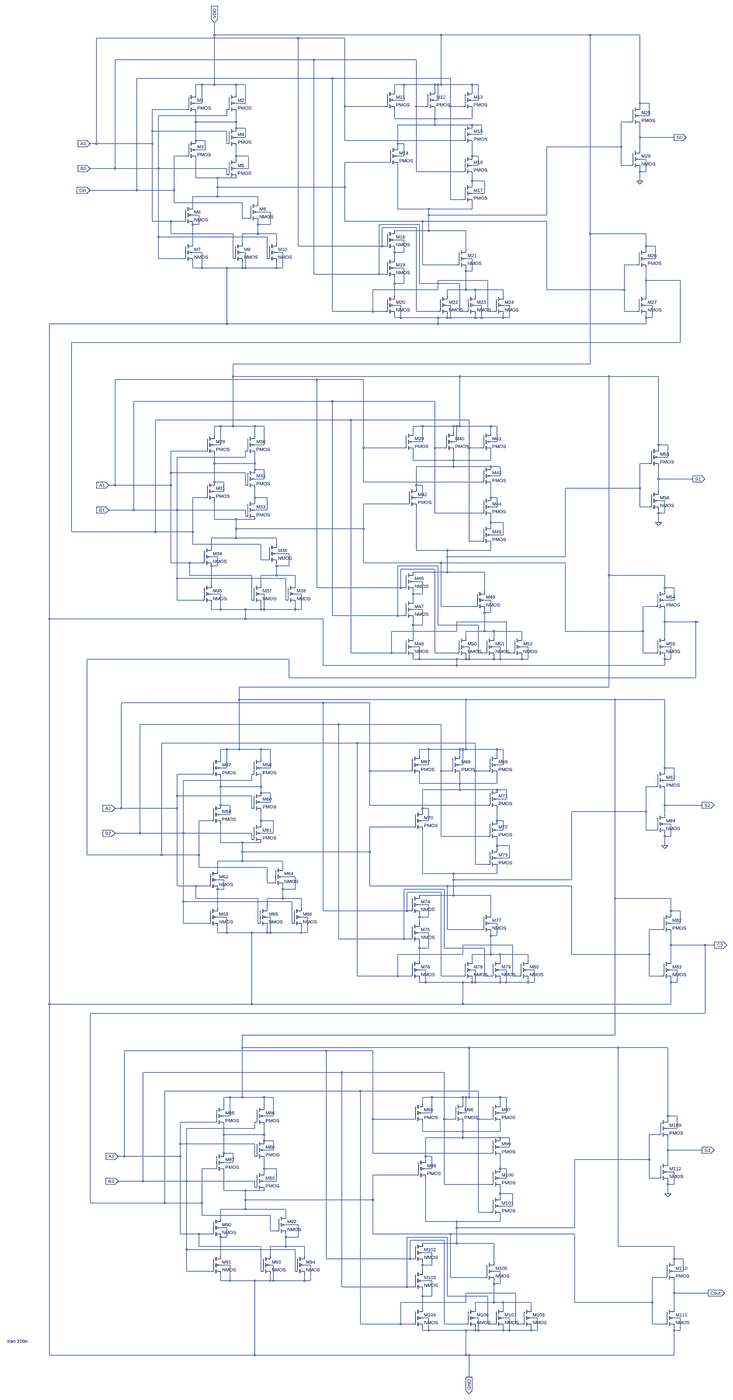
[diagram p0: schematic 4bit_Adder.asc, whole sheet]
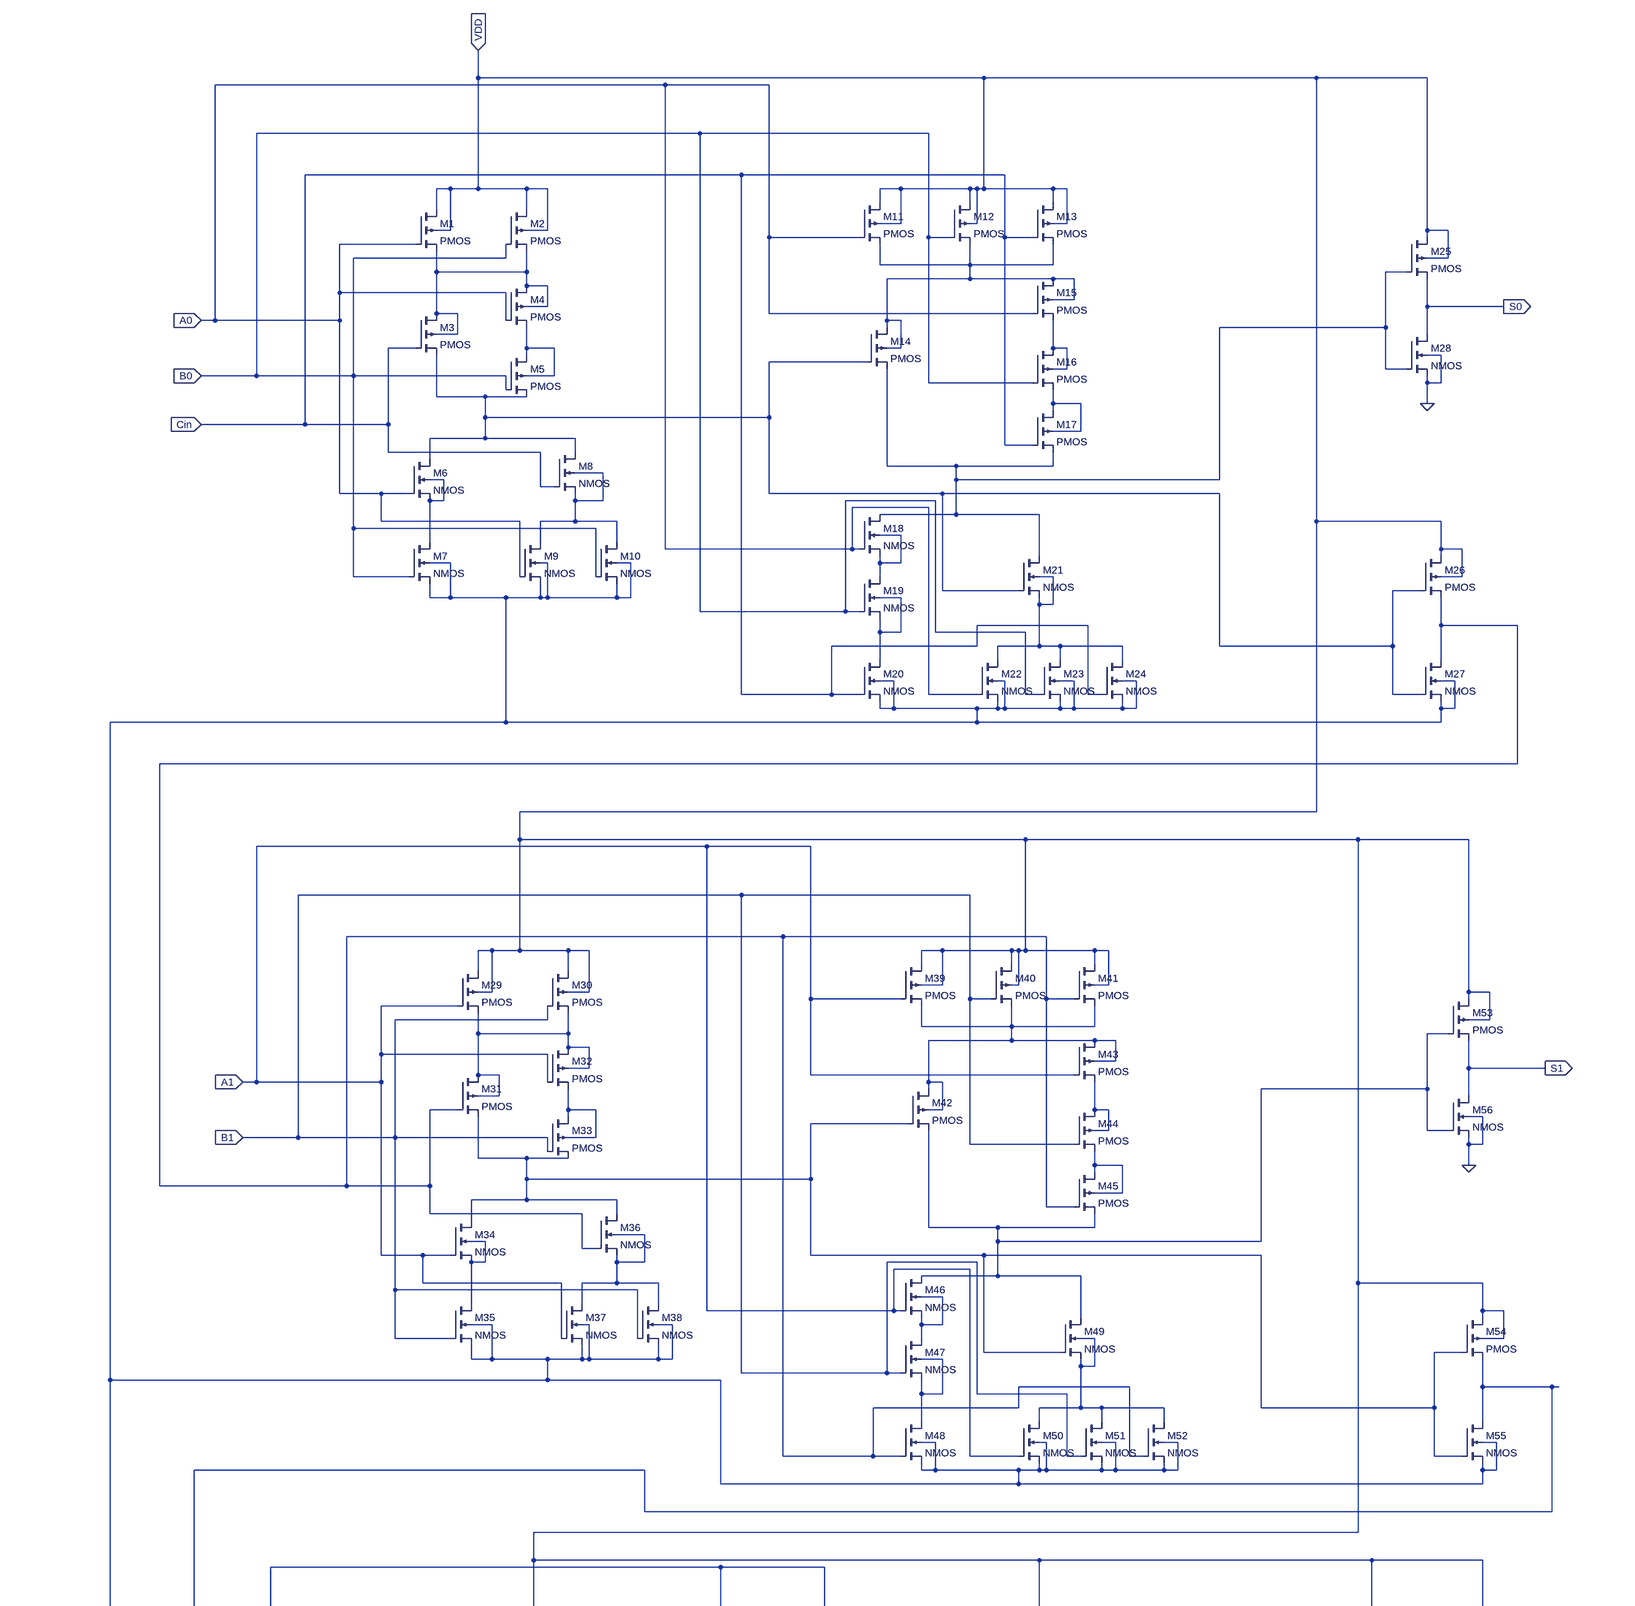
[diagram p1: schematic 4bit_Adder.asc, part, row 1 of 2, column 1 of 1]
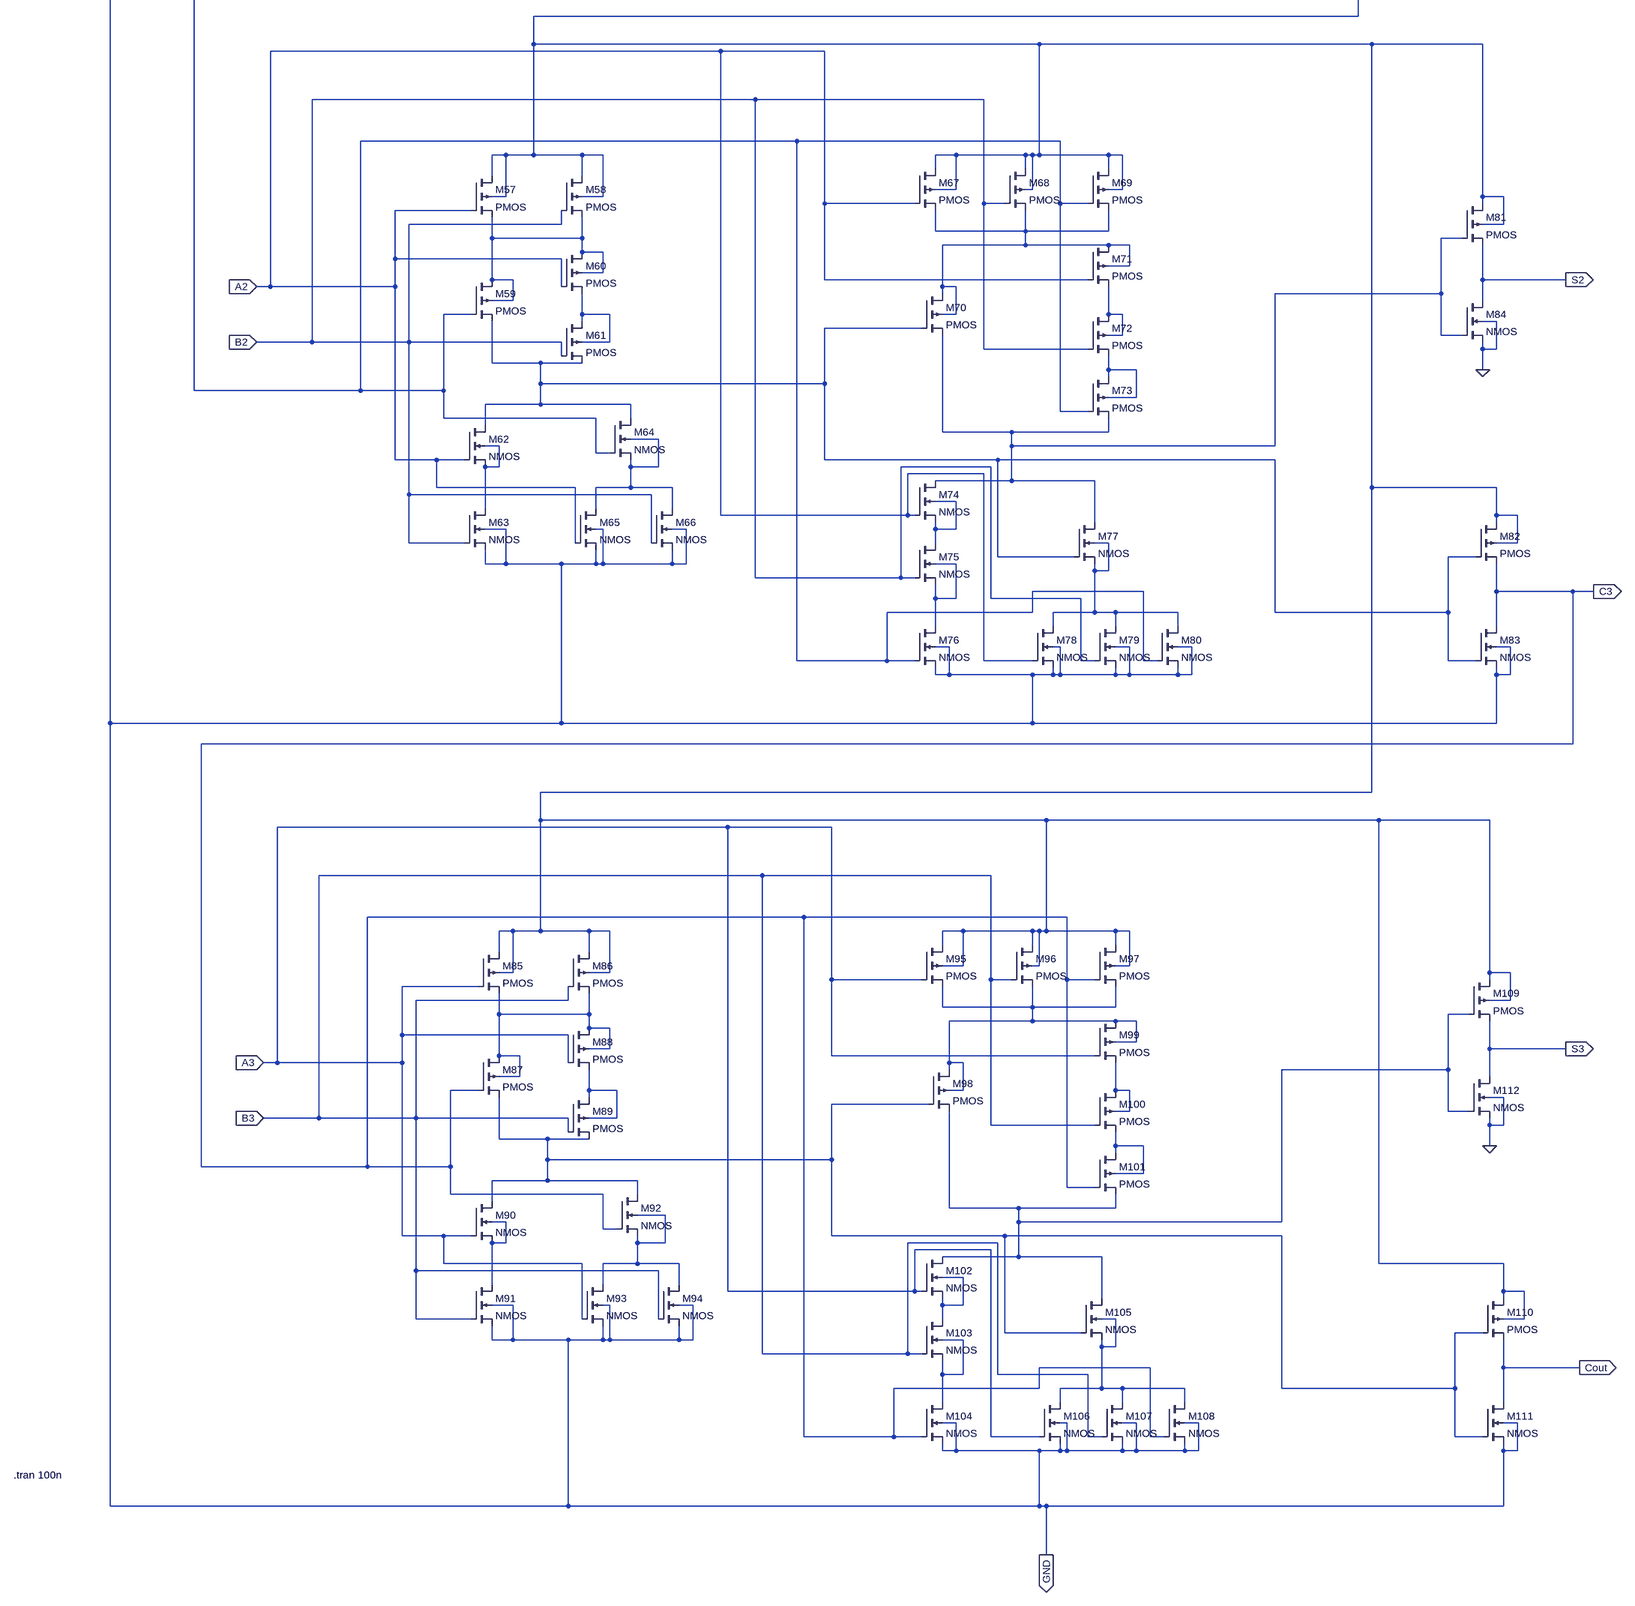
[diagram p2: schematic 4bit_Adder.asc, part, row 2 of 2, column 1 of 1]
4bit_Adder.asc, the LTspice schematic file:
Version 4.1
SHEET 1 1208 2768
WIRE -1456 -4464 -1456 -4528
WIRE -288 -4464 -1456 -4464
WIRE 480 -4464 -288 -4464
WIRE 736 -4464 480 -4464
WIRE -1024 -4448 -2064 -4448
WIRE -784 -4448 -1024 -4448
WIRE -944 -4336 -1968 -4336
WIRE -416 -4336 -944 -4336
WIRE -848 -4240 -1856 -4240
WIRE -240 -4240 -848 -4240
WIRE -1520 -4208 -1552 -4208
WIRE -1456 -4208 -1456 -4464
WIRE -1456 -4208 -1520 -4208
WIRE -1344 -4208 -1456 -4208
WIRE -1296 -4208 -1344 -4208
WIRE -480 -4208 -528 -4208
WIRE -320 -4208 -480 -4208
WIRE -304 -4208 -320 -4208
WIRE -288 -4208 -288 -4464
WIRE -288 -4208 -304 -4208
WIRE -128 -4208 -288 -4208
WIRE -96 -4208 -128 -4208
WIRE -528 -4176 -528 -4208
WIRE -320 -4176 -320 -4208
WIRE -128 -4176 -128 -4208
WIRE -1552 -4160 -1552 -4208
WIRE -1344 -4160 -1344 -4208
WIRE -480 -4128 -480 -4208
WIRE -480 -4128 -528 -4128
WIRE -304 -4128 -304 -4208
WIRE -304 -4128 -320 -4128
WIRE -96 -4128 -96 -4208
WIRE -96 -4128 -128 -4128
WIRE -1520 -4112 -1520 -4208
WIRE -1520 -4112 -1552 -4112
WIRE -1296 -4112 -1296 -4208
WIRE -1296 -4112 -1344 -4112
WIRE 736 -4112 736 -4464
WIRE 784 -4112 736 -4112
WIRE -784 -4096 -784 -4448
WIRE -576 -4096 -784 -4096
WIRE -416 -4096 -416 -4336
WIRE -368 -4096 -416 -4096
WIRE -240 -4096 -240 -4240
WIRE -176 -4096 -240 -4096
WIRE 736 -4096 736 -4112
WIRE -1600 -4080 -1776 -4080
WIRE -1392 -4048 -1392 -4080
WIRE -1392 -4048 -1744 -4048
WIRE 784 -4048 784 -4112
WIRE 784 -4048 736 -4048
WIRE -528 -4032 -528 -4080
WIRE -320 -4032 -320 -4080
WIRE -320 -4032 -528 -4032
WIRE -128 -4032 -128 -4080
WIRE -128 -4032 -320 -4032
WIRE -1552 -4016 -1552 -4064
WIRE -1344 -4016 -1344 -4064
WIRE -1344 -4016 -1552 -4016
WIRE 688 -4016 640 -4016
WIRE -320 -4000 -320 -4032
WIRE -320 -4000 -512 -4000
WIRE -128 -4000 -320 -4000
WIRE -80 -4000 -128 -4000
WIRE -1344 -3984 -1344 -4016
WIRE -1296 -3984 -1344 -3984
WIRE -1776 -3968 -1776 -4080
WIRE -1392 -3968 -1776 -3968
WIRE -80 -3952 -80 -4000
WIRE -80 -3952 -128 -3952
WIRE -1296 -3936 -1296 -3984
WIRE -1296 -3936 -1344 -3936
WIRE 736 -3936 736 -4000
WIRE 912 -3936 736 -3936
WIRE -1552 -3920 -1552 -4016
WIRE -1504 -3920 -1552 -3920
WIRE -784 -3920 -784 -4096
WIRE -176 -3920 -784 -3920
WIRE -2064 -3904 -2064 -4448
WIRE -2064 -3904 -2096 -3904
WIRE -1776 -3904 -1776 -3968
WIRE -1776 -3904 -2064 -3904
WIRE -1392 -3904 -1392 -3968
WIRE -512 -3904 -512 -4000
WIRE -480 -3904 -512 -3904
WIRE -512 -3888 -512 -3904
WIRE 640 -3888 640 -4016
WIRE 640 -3888 256 -3888
WIRE -1504 -3872 -1504 -3920
WIRE -1504 -3872 -1552 -3872
WIRE 736 -3872 736 -3936
WIRE -1600 -3840 -1664 -3840
WIRE -1344 -3840 -1344 -3888
WIRE -1280 -3840 -1344 -3840
WIRE -480 -3840 -480 -3904
WIRE -480 -3840 -512 -3840
WIRE -128 -3840 -128 -3904
WIRE -96 -3840 -128 -3840
WIRE -1344 -3824 -1344 -3840
WIRE 768 -3824 736 -3824
WIRE -560 -3808 -784 -3808
WIRE -96 -3792 -96 -3840
WIRE -96 -3792 -128 -3792
WIRE 640 -3792 640 -3888
WIRE 688 -3792 640 -3792
WIRE -1968 -3776 -1968 -4336
WIRE -1968 -3776 -2096 -3776
WIRE -1744 -3776 -1744 -4048
WIRE -1744 -3776 -1968 -3776
WIRE -1392 -3776 -1744 -3776
WIRE -1280 -3776 -1280 -3840
WIRE -1280 -3776 -1344 -3776
WIRE -416 -3760 -416 -4096
WIRE -176 -3760 -416 -3760
WIRE 736 -3760 736 -3776
WIRE 768 -3760 768 -3824
WIRE 768 -3760 736 -3760
WIRE -1392 -3744 -1392 -3776
WIRE -1552 -3728 -1552 -3824
WIRE -1440 -3728 -1552 -3728
WIRE -1344 -3728 -1440 -3728
WIRE -128 -3712 -128 -3744
WIRE -64 -3712 -128 -3712
WIRE 736 -3712 736 -3760
WIRE -128 -3696 -128 -3712
WIRE -1440 -3680 -1440 -3728
WIRE -784 -3680 -784 -3808
WIRE -784 -3680 -1440 -3680
WIRE -1856 -3664 -1856 -4240
WIRE -1856 -3664 -2096 -3664
WIRE -1664 -3664 -1664 -3840
WIRE -1664 -3664 -1856 -3664
WIRE -64 -3648 -64 -3712
WIRE -64 -3648 -128 -3648
WIRE -1440 -3632 -1440 -3680
WIRE -1440 -3632 -1568 -3632
WIRE -1232 -3632 -1440 -3632
WIRE -240 -3616 -240 -4096
WIRE -176 -3616 -240 -3616
WIRE -1664 -3600 -1664 -3664
WIRE -1312 -3600 -1664 -3600
WIRE -1232 -3600 -1232 -3632
WIRE -1568 -3584 -1568 -3632
WIRE -512 -3568 -512 -3792
WIRE -352 -3568 -512 -3568
WIRE -128 -3568 -128 -3600
WIRE -128 -3568 -352 -3568
WIRE -1168 -3552 -1232 -3552
WIRE -1536 -3536 -1568 -3536
WIRE -352 -3536 -352 -3568
WIRE 256 -3536 256 -3888
WIRE 256 -3536 -352 -3536
WIRE -1312 -3520 -1312 -3600
WIRE -1280 -3520 -1312 -3520
WIRE -1776 -3504 -1776 -3904
WIRE -1680 -3504 -1776 -3504
WIRE -1616 -3504 -1680 -3504
WIRE -784 -3504 -784 -3680
WIRE -384 -3504 -784 -3504
WIRE 256 -3504 -384 -3504
WIRE -1536 -3488 -1536 -3536
WIRE -1536 -3488 -1568 -3488
WIRE -1232 -3488 -1232 -3504
WIRE -1168 -3488 -1168 -3552
WIRE -1168 -3488 -1232 -3488
WIRE -400 -3488 -608 -3488
WIRE -416 -3472 -592 -3472
WIRE -352 -3456 -352 -3536
WIRE -352 -3456 -528 -3456
WIRE -160 -3456 -352 -3456
WIRE -1680 -3440 -1680 -3504
WIRE -1360 -3440 -1680 -3440
WIRE -1232 -3440 -1232 -3488
WIRE -1232 -3440 -1312 -3440
WIRE -1136 -3440 -1232 -3440
WIRE 480 -3440 480 -4464
WIRE 768 -3440 480 -3440
WIRE -1744 -3424 -1744 -3776
WIRE -1184 -3424 -1744 -3424
WIRE -480 -3408 -528 -3408
WIRE -1568 -3392 -1568 -3488
WIRE -1312 -3392 -1312 -3440
WIRE -1136 -3392 -1136 -3440
WIRE -1024 -3376 -1024 -4448
WIRE -592 -3376 -592 -3472
WIRE -592 -3376 -1024 -3376
WIRE -576 -3376 -592 -3376
WIRE 768 -3376 768 -3440
WIRE 816 -3376 768 -3376
WIRE -160 -3360 -160 -3456
WIRE 768 -3360 768 -3376
WIRE -1520 -3344 -1568 -3344
WIRE -1296 -3344 -1312 -3344
WIRE -1104 -3344 -1136 -3344
WIRE -528 -3344 -528 -3360
WIRE -480 -3344 -480 -3408
WIRE -480 -3344 -528 -3344
WIRE -1744 -3312 -1744 -3424
WIRE -1616 -3312 -1744 -3312
WIRE -1360 -3312 -1360 -3440
WIRE -1184 -3312 -1184 -3424
WIRE -528 -3312 -528 -3344
WIRE -128 -3312 -160 -3312
WIRE 816 -3312 816 -3376
WIRE 816 -3312 768 -3312
WIRE -384 -3280 -384 -3504
WIRE -208 -3280 -384 -3280
WIRE 720 -3280 656 -3280
WIRE -1568 -3264 -1568 -3296
WIRE -1520 -3264 -1520 -3344
WIRE -1520 -3264 -1568 -3264
WIRE -1392 -3264 -1520 -3264
WIRE -1312 -3264 -1312 -3296
WIRE -1312 -3264 -1392 -3264
WIRE -1296 -3264 -1296 -3344
WIRE -1296 -3264 -1312 -3264
WIRE -1136 -3264 -1136 -3296
WIRE -1136 -3264 -1296 -3264
WIRE -1104 -3264 -1104 -3344
WIRE -1104 -3264 -1136 -3264
WIRE -480 -3264 -528 -3264
WIRE -160 -3248 -160 -3264
WIRE -128 -3248 -128 -3312
WIRE -128 -3248 -160 -3248
WIRE -944 -3232 -944 -4336
WIRE -608 -3232 -608 -3488
WIRE -608 -3232 -944 -3232
WIRE -576 -3232 -608 -3232
WIRE -48 -3200 -304 -3200
WIRE 768 -3200 768 -3264
WIRE 944 -3200 768 -3200
WIRE -528 -3184 -528 -3216
WIRE -480 -3184 -480 -3264
WIRE -480 -3184 -528 -3184
WIRE -400 -3184 -400 -3488
WIRE -192 -3184 -400 -3184
WIRE -304 -3152 -304 -3200
WIRE -304 -3152 -640 -3152
WIRE -160 -3152 -160 -3248
WIRE -160 -3152 -256 -3152
WIRE -112 -3152 -160 -3152
WIRE 32 -3152 -112 -3152
WIRE 256 -3152 256 -3504
WIRE 656 -3152 656 -3280
WIRE 656 -3152 256 -3152
WIRE -528 -3120 -528 -3184
WIRE -256 -3120 -256 -3152
WIRE -112 -3120 -112 -3152
WIRE 32 -3120 32 -3152
WIRE 768 -3120 768 -3200
WIRE -496 -3072 -528 -3072
WIRE -240 -3072 -256 -3072
WIRE -80 -3072 -112 -3072
WIRE 64 -3072 32 -3072
WIRE 800 -3072 768 -3072
WIRE -848 -3040 -848 -4240
WIRE -640 -3040 -640 -3152
WIRE -640 -3040 -848 -3040
WIRE -576 -3040 -640 -3040
WIRE -416 -3040 -416 -3472
WIRE -304 -3040 -416 -3040
WIRE -192 -3040 -192 -3184
WIRE -160 -3040 -192 -3040
WIRE -48 -3040 -48 -3200
WIRE -16 -3040 -48 -3040
WIRE 656 -3040 656 -3152
WIRE 720 -3040 656 -3040
WIRE -528 -3008 -528 -3024
WIRE -496 -3008 -496 -3072
WIRE -496 -3008 -528 -3008
WIRE -304 -3008 -496 -3008
WIRE -256 -3008 -256 -3024
WIRE -256 -3008 -304 -3008
WIRE -240 -3008 -240 -3072
WIRE -240 -3008 -256 -3008
WIRE -112 -3008 -112 -3024
WIRE -112 -3008 -240 -3008
WIRE -80 -3008 -80 -3072
WIRE -80 -3008 -112 -3008
WIRE 32 -3008 32 -3024
WIRE 32 -3008 -80 -3008
WIRE 64 -3008 64 -3072
WIRE 64 -3008 32 -3008
WIRE 768 -3008 768 -3024
WIRE 800 -3008 800 -3072
WIRE 800 -3008 768 -3008
WIRE -1392 -2976 -1392 -3264
WIRE -1392 -2976 -2384 -2976
WIRE -304 -2976 -304 -3008
WIRE -304 -2976 -1392 -2976
WIRE 768 -2976 768 -3008
WIRE 768 -2976 -304 -2976
WIRE 944 -2880 944 -3200
WIRE 944 -2880 -2192 -2880
WIRE 480 -2624 480 -3440
WIRE 480 -2624 -1360 -2624
WIRE -1360 -2560 -1360 -2624
WIRE -192 -2560 -1360 -2560
WIRE 576 -2560 -192 -2560
WIRE 832 -2560 576 -2560
WIRE -928 -2544 -1968 -2544
WIRE -688 -2544 -928 -2544
WIRE -848 -2432 -1872 -2432
WIRE -320 -2432 -848 -2432
WIRE -752 -2336 -1760 -2336
WIRE -144 -2336 -752 -2336
WIRE -1424 -2304 -1456 -2304
WIRE -1360 -2304 -1360 -2560
WIRE -1360 -2304 -1424 -2304
WIRE -1248 -2304 -1360 -2304
WIRE -1200 -2304 -1248 -2304
WIRE -384 -2304 -432 -2304
WIRE -224 -2304 -384 -2304
WIRE -208 -2304 -224 -2304
WIRE -192 -2304 -192 -2560
WIRE -192 -2304 -208 -2304
WIRE -32 -2304 -192 -2304
WIRE 0 -2304 -32 -2304
WIRE -432 -2272 -432 -2304
WIRE -224 -2272 -224 -2304
WIRE -32 -2272 -32 -2304
WIRE -1456 -2256 -1456 -2304
WIRE -1248 -2256 -1248 -2304
WIRE -384 -2224 -384 -2304
WIRE -384 -2224 -432 -2224
WIRE -208 -2224 -208 -2304
WIRE -208 -2224 -224 -2224
WIRE 0 -2224 0 -2304
WIRE 0 -2224 -32 -2224
WIRE -1424 -2208 -1424 -2304
WIRE -1424 -2208 -1456 -2208
WIRE -1200 -2208 -1200 -2304
WIRE -1200 -2208 -1248 -2208
WIRE 832 -2208 832 -2560
WIRE 880 -2208 832 -2208
WIRE -688 -2192 -688 -2544
WIRE -480 -2192 -688 -2192
WIRE -320 -2192 -320 -2432
WIRE -272 -2192 -320 -2192
WIRE -144 -2192 -144 -2336
WIRE -80 -2192 -144 -2192
WIRE 832 -2192 832 -2208
WIRE -1504 -2176 -1680 -2176
WIRE -1296 -2144 -1296 -2176
WIRE -1296 -2144 -1648 -2144
WIRE 880 -2144 880 -2208
WIRE 880 -2144 832 -2144
WIRE -432 -2128 -432 -2176
WIRE -224 -2128 -224 -2176
WIRE -224 -2128 -432 -2128
WIRE -32 -2128 -32 -2176
WIRE -32 -2128 -224 -2128
WIRE -1456 -2112 -1456 -2160
WIRE -1248 -2112 -1248 -2160
WIRE -1248 -2112 -1456 -2112
WIRE 784 -2112 736 -2112
WIRE -224 -2096 -224 -2128
WIRE -224 -2096 -416 -2096
WIRE -32 -2096 -224 -2096
WIRE 16 -2096 -32 -2096
WIRE -1248 -2080 -1248 -2112
WIRE -1200 -2080 -1248 -2080
WIRE -1680 -2064 -1680 -2176
WIRE -1296 -2064 -1680 -2064
WIRE 16 -2048 16 -2096
WIRE 16 -2048 -32 -2048
WIRE -1200 -2032 -1200 -2080
WIRE -1200 -2032 -1248 -2032
WIRE 832 -2032 832 -2096
WIRE 1008 -2032 832 -2032
WIRE -1456 -2016 -1456 -2112
WIRE -1408 -2016 -1456 -2016
WIRE -688 -2016 -688 -2192
WIRE -80 -2016 -688 -2016
WIRE -1968 -2000 -1968 -2544
WIRE -1968 -2000 -2000 -2000
WIRE -1680 -2000 -1680 -2064
WIRE -1680 -2000 -1968 -2000
WIRE -1296 -2000 -1296 -2064
WIRE -416 -2000 -416 -2096
WIRE -384 -2000 -416 -2000
WIRE -416 -1984 -416 -2000
WIRE 736 -1984 736 -2112
WIRE 736 -1984 352 -1984
WIRE -1408 -1968 -1408 -2016
WIRE -1408 -1968 -1456 -1968
WIRE 832 -1968 832 -2032
WIRE -1504 -1936 -1568 -1936
WIRE -1248 -1936 -1248 -1984
WIRE -1184 -1936 -1248 -1936
WIRE -384 -1936 -384 -2000
WIRE -384 -1936 -416 -1936
WIRE -32 -1936 -32 -2000
WIRE 0 -1936 -32 -1936
WIRE -1248 -1920 -1248 -1936
WIRE 864 -1920 832 -1920
WIRE -464 -1904 -688 -1904
WIRE 0 -1888 0 -1936
WIRE 0 -1888 -32 -1888
WIRE 736 -1888 736 -1984
WIRE 784 -1888 736 -1888
WIRE -1872 -1872 -1872 -2432
WIRE -1872 -1872 -2000 -1872
WIRE -1648 -1872 -1648 -2144
WIRE -1648 -1872 -1872 -1872
WIRE -1296 -1872 -1648 -1872
WIRE -1184 -1872 -1184 -1936
WIRE -1184 -1872 -1248 -1872
WIRE -320 -1856 -320 -2192
WIRE -80 -1856 -320 -1856
WIRE 832 -1856 832 -1872
WIRE 864 -1856 864 -1920
WIRE 864 -1856 832 -1856
WIRE -1296 -1840 -1296 -1872
WIRE -1456 -1824 -1456 -1920
WIRE -1344 -1824 -1456 -1824
WIRE -1248 -1824 -1344 -1824
WIRE -32 -1808 -32 -1840
WIRE 32 -1808 -32 -1808
WIRE 832 -1808 832 -1856
WIRE -32 -1792 -32 -1808
WIRE -1344 -1776 -1344 -1824
WIRE -688 -1776 -688 -1904
WIRE -688 -1776 -1344 -1776
WIRE -2192 -1760 -2192 -2880
WIRE -1760 -1760 -1760 -2336
WIRE -1760 -1760 -2192 -1760
WIRE -1568 -1760 -1568 -1936
WIRE -1568 -1760 -1760 -1760
WIRE 32 -1744 32 -1808
WIRE 32 -1744 -32 -1744
WIRE -1344 -1728 -1344 -1776
WIRE -1344 -1728 -1472 -1728
WIRE -1136 -1728 -1344 -1728
WIRE -144 -1712 -144 -2192
WIRE -80 -1712 -144 -1712
WIRE -1568 -1696 -1568 -1760
WIRE -1216 -1696 -1568 -1696
WIRE -1136 -1696 -1136 -1728
WIRE -1472 -1680 -1472 -1728
WIRE -416 -1664 -416 -1888
WIRE -256 -1664 -416 -1664
WIRE -32 -1664 -32 -1696
WIRE -32 -1664 -256 -1664
WIRE -1072 -1648 -1136 -1648
WIRE -1440 -1632 -1472 -1632
WIRE -256 -1632 -256 -1664
WIRE 352 -1632 352 -1984
WIRE 352 -1632 -256 -1632
WIRE -1216 -1616 -1216 -1696
WIRE -1184 -1616 -1216 -1616
WIRE -1680 -1600 -1680 -2000
WIRE -1584 -1600 -1680 -1600
WIRE -1520 -1600 -1584 -1600
WIRE -688 -1600 -688 -1776
WIRE -288 -1600 -688 -1600
WIRE 352 -1600 -288 -1600
WIRE -1440 -1584 -1440 -1632
WIRE -1440 -1584 -1472 -1584
WIRE -1136 -1584 -1136 -1600
WIRE -1072 -1584 -1072 -1648
WIRE -1072 -1584 -1136 -1584
WIRE -304 -1584 -512 -1584
WIRE -320 -1568 -496 -1568
WIRE -256 -1552 -256 -1632
WIRE -256 -1552 -432 -1552
WIRE -64 -1552 -256 -1552
WIRE -1584 -1536 -1584 -1600
WIRE -1264 -1536 -1584 -1536
WIRE -1136 -1536 -1136 -1584
WIRE -1136 -1536 -1216 -1536
WIRE -1040 -1536 -1136 -1536
WIRE 576 -1536 576 -2560
WIRE 864 -1536 576 -1536
WIRE -1648 -1520 -1648 -1872
WIRE -1088 -1520 -1648 -1520
WIRE -384 -1504 -432 -1504
WIRE -1472 -1488 -1472 -1584
WIRE -1216 -1488 -1216 -1536
WIRE -1040 -1488 -1040 -1536
WIRE -928 -1472 -928 -2544
WIRE -496 -1472 -496 -1568
WIRE -496 -1472 -928 -1472
WIRE -480 -1472 -496 -1472
WIRE 864 -1472 864 -1536
WIRE 912 -1472 864 -1472
WIRE -64 -1456 -64 -1552
WIRE 864 -1456 864 -1472
WIRE -1424 -1440 -1472 -1440
WIRE -1200 -1440 -1216 -1440
WIRE -1008 -1440 -1040 -1440
WIRE -432 -1440 -432 -1456
WIRE -384 -1440 -384 -1504
WIRE -384 -1440 -432 -1440
WIRE -1648 -1408 -1648 -1520
WIRE -1520 -1408 -1648 -1408
WIRE -1264 -1408 -1264 -1536
WIRE -1088 -1408 -1088 -1520
WIRE -432 -1408 -432 -1440
WIRE -32 -1408 -64 -1408
WIRE 912 -1408 912 -1472
WIRE 912 -1408 864 -1408
WIRE -288 -1376 -288 -1600
WIRE -112 -1376 -288 -1376
WIRE 816 -1376 752 -1376
WIRE -1472 -1360 -1472 -1392
WIRE -1424 -1360 -1424 -1440
WIRE -1424 -1360 -1472 -1360
WIRE -1296 -1360 -1424 -1360
WIRE -1216 -1360 -1216 -1392
WIRE -1216 -1360 -1296 -1360
WIRE -1200 -1360 -1200 -1440
WIRE -1200 -1360 -1216 -1360
WIRE -1040 -1360 -1040 -1392
WIRE -1040 -1360 -1200 -1360
WIRE -1008 -1360 -1008 -1440
WIRE -1008 -1360 -1040 -1360
WIRE -384 -1360 -432 -1360
WIRE -64 -1344 -64 -1360
WIRE -32 -1344 -32 -1408
WIRE -32 -1344 -64 -1344
WIRE -848 -1328 -848 -2432
WIRE -512 -1328 -512 -1584
WIRE -512 -1328 -848 -1328
WIRE -480 -1328 -512 -1328
WIRE -2384 -1312 -2384 -2976
WIRE -1296 -1312 -1296 -1360
WIRE -1296 -1312 -2384 -1312
WIRE -896 -1312 -1296 -1312
WIRE 48 -1296 -208 -1296
WIRE 864 -1296 864 -1360
WIRE 1024 -1296 864 -1296
WIRE 1040 -1296 1024 -1296
WIRE -432 -1280 -432 -1312
WIRE -384 -1280 -384 -1360
WIRE -384 -1280 -432 -1280
WIRE -304 -1280 -304 -1584
WIRE -96 -1280 -304 -1280
WIRE -208 -1248 -208 -1296
WIRE -208 -1248 -544 -1248
WIRE -64 -1248 -64 -1344
WIRE -64 -1248 -160 -1248
WIRE -16 -1248 -64 -1248
WIRE 128 -1248 -16 -1248
WIRE 352 -1248 352 -1600
WIRE 752 -1248 752 -1376
WIRE 752 -1248 352 -1248
WIRE -432 -1216 -432 -1280
WIRE -160 -1216 -160 -1248
WIRE -16 -1216 -16 -1248
WIRE 128 -1216 128 -1248
WIRE 864 -1216 864 -1296
WIRE -400 -1168 -432 -1168
WIRE -144 -1168 -160 -1168
WIRE 16 -1168 -16 -1168
WIRE 160 -1168 128 -1168
WIRE 896 -1168 864 -1168
WIRE -752 -1136 -752 -2336
WIRE -544 -1136 -544 -1248
WIRE -544 -1136 -752 -1136
WIRE -480 -1136 -544 -1136
WIRE -320 -1136 -320 -1568
WIRE -208 -1136 -320 -1136
WIRE -96 -1136 -96 -1280
WIRE -64 -1136 -96 -1136
WIRE 48 -1136 48 -1296
WIRE 80 -1136 48 -1136
WIRE 752 -1136 752 -1248
WIRE 816 -1136 752 -1136
WIRE -1072 -1104 -2112 -1104
WIRE -432 -1104 -432 -1120
WIRE -400 -1104 -400 -1168
WIRE -400 -1104 -432 -1104
WIRE -208 -1104 -400 -1104
WIRE -160 -1104 -160 -1120
WIRE -160 -1104 -208 -1104
WIRE -144 -1104 -144 -1168
WIRE -144 -1104 -160 -1104
WIRE -16 -1104 -16 -1120
WIRE -16 -1104 -144 -1104
WIRE 16 -1104 16 -1168
WIRE 16 -1104 -16 -1104
WIRE 128 -1104 128 -1120
WIRE 128 -1104 16 -1104
WIRE 160 -1104 160 -1168
WIRE 160 -1104 128 -1104
WIRE 864 -1104 864 -1120
WIRE 896 -1104 896 -1168
WIRE 896 -1104 864 -1104
WIRE -896 -1072 -896 -1312
WIRE -208 -1072 -208 -1104
WIRE -208 -1072 -896 -1072
WIRE 864 -1072 864 -1104
WIRE 864 -1072 -208 -1072
WIRE -1072 -1008 -1072 -1104
WIRE 1024 -1008 1024 -1296
WIRE 1024 -1008 -1072 -1008
WIRE 576 -960 576 -1536
WIRE 576 -960 -1328 -960
WIRE -1328 -896 -1328 -960
WIRE -160 -896 -1328 -896
WIRE 608 -896 -160 -896
WIRE 864 -896 608 -896
WIRE -896 -880 -1936 -880
WIRE -656 -880 -896 -880
WIRE -816 -768 -1840 -768
WIRE -288 -768 -816 -768
WIRE -720 -672 -1728 -672
WIRE -112 -672 -720 -672
WIRE -1392 -640 -1424 -640
WIRE -1328 -640 -1328 -896
WIRE -1328 -640 -1392 -640
WIRE -1216 -640 -1328 -640
WIRE -1168 -640 -1216 -640
WIRE -352 -640 -400 -640
WIRE -192 -640 -352 -640
WIRE -176 -640 -192 -640
WIRE -160 -640 -160 -896
WIRE -160 -640 -176 -640
WIRE 0 -640 -160 -640
WIRE 32 -640 0 -640
WIRE -400 -608 -400 -640
WIRE -192 -608 -192 -640
WIRE 0 -608 0 -640
WIRE -1424 -592 -1424 -640
WIRE -1216 -592 -1216 -640
WIRE -352 -560 -352 -640
WIRE -352 -560 -400 -560
WIRE -176 -560 -176 -640
WIRE -176 -560 -192 -560
WIRE 32 -560 32 -640
WIRE 32 -560 0 -560
WIRE -1392 -544 -1392 -640
WIRE -1392 -544 -1424 -544
WIRE -1168 -544 -1168 -640
WIRE -1168 -544 -1216 -544
WIRE 864 -544 864 -896
WIRE 912 -544 864 -544
WIRE -656 -528 -656 -880
WIRE -448 -528 -656 -528
WIRE -288 -528 -288 -768
WIRE -240 -528 -288 -528
WIRE -112 -528 -112 -672
WIRE -48 -528 -112 -528
WIRE 864 -528 864 -544
WIRE -1472 -512 -1648 -512
WIRE -1264 -480 -1264 -512
WIRE -1264 -480 -1616 -480
WIRE 912 -480 912 -544
WIRE 912 -480 864 -480
WIRE -400 -464 -400 -512
WIRE -192 -464 -192 -512
WIRE -192 -464 -400 -464
WIRE 0 -464 0 -512
WIRE 0 -464 -192 -464
WIRE -1424 -448 -1424 -496
WIRE -1216 -448 -1216 -496
WIRE -1216 -448 -1424 -448
WIRE 816 -448 768 -448
WIRE -192 -432 -192 -464
WIRE -192 -432 -384 -432
WIRE 0 -432 -192 -432
WIRE 48 -432 0 -432
WIRE -1216 -416 -1216 -448
WIRE -1168 -416 -1216 -416
WIRE -1648 -400 -1648 -512
WIRE -1264 -400 -1648 -400
WIRE 48 -384 48 -432
WIRE 48 -384 0 -384
WIRE -1168 -368 -1168 -416
WIRE -1168 -368 -1216 -368
WIRE -1424 -352 -1424 -448
WIRE -1376 -352 -1424 -352
WIRE -656 -352 -656 -528
WIRE -48 -352 -656 -352
WIRE 864 -352 864 -432
WIRE 1056 -352 864 -352
WIRE -1936 -336 -1936 -880
WIRE -1936 -336 -1968 -336
WIRE -1648 -336 -1648 -400
WIRE -1648 -336 -1936 -336
WIRE -1264 -336 -1264 -400
WIRE -384 -336 -384 -432
WIRE -352 -336 -384 -336
WIRE -384 -320 -384 -336
WIRE 768 -320 768 -448
WIRE 768 -320 384 -320
WIRE -1376 -304 -1376 -352
WIRE -1376 -304 -1424 -304
WIRE 864 -304 864 -352
WIRE -1472 -272 -1536 -272
WIRE -1216 -272 -1216 -320
WIRE -1152 -272 -1216 -272
WIRE -352 -272 -352 -336
WIRE -352 -272 -384 -272
WIRE 0 -272 0 -336
WIRE 32 -272 0 -272
WIRE -1216 -256 -1216 -272
WIRE 896 -256 864 -256
WIRE -432 -240 -656 -240
WIRE 32 -224 32 -272
WIRE 32 -224 0 -224
WIRE 768 -224 768 -320
WIRE 816 -224 768 -224
WIRE -1840 -208 -1840 -768
WIRE -1840 -208 -1968 -208
WIRE -1616 -208 -1616 -480
WIRE -1616 -208 -1840 -208
WIRE -1264 -208 -1616 -208
WIRE -1152 -208 -1152 -272
WIRE -1152 -208 -1216 -208
WIRE -288 -192 -288 -528
WIRE -48 -192 -288 -192
WIRE 864 -192 864 -208
WIRE 896 -192 896 -256
WIRE 896 -192 864 -192
WIRE -1264 -176 -1264 -208
WIRE -1424 -160 -1424 -256
WIRE -1312 -160 -1424 -160
WIRE -1216 -160 -1312 -160
WIRE 0 -144 0 -176
WIRE 64 -144 0 -144
WIRE 864 -144 864 -192
WIRE 0 -128 0 -144
WIRE -1312 -112 -1312 -160
WIRE -656 -112 -656 -240
WIRE -656 -112 -1312 -112
WIRE -2112 -96 -2112 -1104
WIRE -1728 -96 -1728 -672
WIRE -1728 -96 -2112 -96
WIRE -1536 -96 -1536 -272
WIRE -1536 -96 -1728 -96
WIRE 64 -80 64 -144
WIRE 64 -80 0 -80
WIRE -1312 -64 -1312 -112
WIRE -1312 -64 -1440 -64
WIRE -1104 -64 -1312 -64
WIRE -112 -48 -112 -528
WIRE -48 -48 -112 -48
WIRE -1536 -32 -1536 -96
WIRE -1184 -32 -1536 -32
WIRE -1104 -32 -1104 -64
WIRE -1440 -16 -1440 -64
WIRE -384 0 -384 -224
WIRE -224 0 -384 0
WIRE 0 0 0 -32
WIRE 0 0 -224 0
WIRE -1040 16 -1104 16
WIRE -1408 32 -1440 32
WIRE -224 32 -224 0
WIRE 384 32 384 -320
WIRE 384 32 -224 32
WIRE -1184 48 -1184 -32
WIRE -1152 48 -1184 48
WIRE -1648 64 -1648 -336
WIRE -1552 64 -1648 64
WIRE -1488 64 -1552 64
WIRE -656 64 -656 -112
WIRE -256 64 -656 64
WIRE 384 64 -256 64
WIRE -1408 80 -1408 32
WIRE -1408 80 -1440 80
WIRE -1104 80 -1104 64
WIRE -1040 80 -1040 16
WIRE -1040 80 -1104 80
WIRE -272 80 -480 80
WIRE -288 96 -464 96
WIRE -224 112 -224 32
WIRE -224 112 -400 112
WIRE -32 112 -224 112
WIRE -1552 128 -1552 64
WIRE -1232 128 -1552 128
WIRE -1104 128 -1104 80
WIRE -1104 128 -1184 128
WIRE -1008 128 -1104 128
WIRE 608 128 608 -896
WIRE 896 128 608 128
WIRE -1616 144 -1616 -208
WIRE -1056 144 -1616 144
WIRE -352 160 -400 160
WIRE -1440 176 -1440 80
WIRE -1184 176 -1184 128
WIRE -1008 176 -1008 128
WIRE -896 192 -896 -880
WIRE -464 192 -464 96
WIRE -464 192 -896 192
WIRE -448 192 -464 192
WIRE 896 192 896 128
WIRE 944 192 896 192
WIRE -32 208 -32 112
WIRE 896 208 896 192
WIRE -1392 224 -1440 224
WIRE -1168 224 -1184 224
WIRE -976 224 -1008 224
WIRE -400 224 -400 208
WIRE -352 224 -352 160
WIRE -352 224 -400 224
WIRE -1616 256 -1616 144
WIRE -1488 256 -1616 256
WIRE -1232 256 -1232 128
WIRE -1056 256 -1056 144
WIRE -400 256 -400 224
WIRE 0 256 -32 256
WIRE 944 256 944 192
WIRE 944 256 896 256
WIRE -256 288 -256 64
WIRE -80 288 -256 288
WIRE 848 288 784 288
WIRE -1440 304 -1440 272
WIRE -1392 304 -1392 224
WIRE -1392 304 -1440 304
WIRE -1264 304 -1392 304
WIRE -1184 304 -1184 272
WIRE -1184 304 -1264 304
WIRE -1168 304 -1168 224
WIRE -1168 304 -1184 304
WIRE -1008 304 -1008 272
WIRE -1008 304 -1168 304
WIRE -976 304 -976 224
WIRE -976 304 -1008 304
WIRE -352 304 -400 304
WIRE -32 320 -32 304
WIRE 0 320 0 256
WIRE 0 320 -32 320
WIRE -816 336 -816 -768
WIRE -480 336 -480 80
WIRE -480 336 -816 336
WIRE -448 336 -480 336
WIRE 80 368 -176 368
WIRE 896 368 896 304
WIRE 1072 368 896 368
WIRE 1120 368 1072 368
WIRE -400 384 -400 352
WIRE -352 384 -352 304
WIRE -352 384 -400 384
WIRE -272 384 -272 80
WIRE -64 384 -272 384
WIRE -176 416 -176 368
WIRE -176 416 -512 416
WIRE -32 416 -32 320
WIRE -32 416 -128 416
WIRE 16 416 -32 416
WIRE 160 416 16 416
WIRE 384 416 384 64
WIRE 784 416 784 288
WIRE 784 416 384 416
WIRE -400 448 -400 384
WIRE -128 448 -128 416
WIRE 16 448 16 416
WIRE 160 448 160 416
WIRE 896 448 896 368
WIRE -368 496 -400 496
WIRE -112 496 -128 496
WIRE 48 496 16 496
WIRE 192 496 160 496
WIRE 928 496 896 496
WIRE -720 528 -720 -672
WIRE -512 528 -512 416
WIRE -512 528 -720 528
WIRE -448 528 -512 528
WIRE -288 528 -288 96
WIRE -176 528 -288 528
WIRE -64 528 -64 384
WIRE -32 528 -64 528
WIRE 80 528 80 368
WIRE 112 528 80 528
WIRE 784 528 784 416
WIRE 848 528 784 528
WIRE -400 560 -400 544
WIRE -368 560 -368 496
WIRE -368 560 -400 560
WIRE -176 560 -368 560
WIRE -128 560 -128 544
WIRE -128 560 -176 560
WIRE -112 560 -112 496
WIRE -112 560 -128 560
WIRE 16 560 16 544
WIRE 16 560 -112 560
WIRE 48 560 48 496
WIRE 48 560 16 560
WIRE 160 560 160 544
WIRE 160 560 48 560
WIRE 192 560 192 496
WIRE 192 560 160 560
WIRE 896 560 896 544
WIRE 928 560 928 496
WIRE 928 560 896 560
WIRE -2384 672 -2384 -1312
WIRE -1264 672 -1264 304
WIRE -1264 672 -2384 672
WIRE -176 672 -176 560
WIRE -176 672 -1264 672
WIRE 896 672 896 560
WIRE 896 672 -176 672
WIRE 1072 720 1072 368
WIRE 1072 720 -2096 720
WIRE 608 896 608 128
WIRE 608 896 -1312 896
WIRE -1312 960 -1312 896
WIRE -144 960 -1312 960
WIRE 624 960 -144 960
WIRE 880 960 624 960
WIRE -880 976 -1920 976
WIRE -640 976 -880 976
WIRE -800 1088 -1824 1088
WIRE -272 1088 -800 1088
WIRE -704 1184 -1712 1184
WIRE -96 1184 -704 1184
WIRE -1376 1216 -1408 1216
WIRE -1312 1216 -1312 960
WIRE -1312 1216 -1376 1216
WIRE -1200 1216 -1312 1216
WIRE -1152 1216 -1200 1216
WIRE -336 1216 -384 1216
WIRE -176 1216 -336 1216
WIRE -160 1216 -176 1216
WIRE -144 1216 -144 960
WIRE -144 1216 -160 1216
WIRE 16 1216 -144 1216
WIRE 48 1216 16 1216
WIRE -384 1248 -384 1216
WIRE -176 1248 -176 1216
WIRE 16 1248 16 1216
WIRE -1408 1264 -1408 1216
WIRE -1200 1264 -1200 1216
WIRE -336 1296 -336 1216
WIRE -336 1296 -384 1296
WIRE -160 1296 -160 1216
WIRE -160 1296 -176 1296
WIRE 48 1296 48 1216
WIRE 48 1296 16 1296
WIRE -1376 1312 -1376 1216
WIRE -1376 1312 -1408 1312
WIRE -1152 1312 -1152 1216
WIRE -1152 1312 -1200 1312
WIRE 880 1312 880 960
WIRE 928 1312 880 1312
WIRE -640 1328 -640 976
WIRE -432 1328 -640 1328
WIRE -272 1328 -272 1088
WIRE -224 1328 -272 1328
WIRE -96 1328 -96 1184
WIRE -32 1328 -96 1328
WIRE 880 1328 880 1312
WIRE -1456 1344 -1632 1344
WIRE -1248 1376 -1248 1344
WIRE -1248 1376 -1600 1376
WIRE 928 1376 928 1312
WIRE 928 1376 880 1376
WIRE -384 1392 -384 1344
WIRE -176 1392 -176 1344
WIRE -176 1392 -384 1392
WIRE 16 1392 16 1344
WIRE 16 1392 -176 1392
WIRE -1408 1408 -1408 1360
WIRE -1200 1408 -1200 1360
WIRE -1200 1408 -1408 1408
WIRE 832 1408 784 1408
WIRE -176 1424 -176 1392
WIRE -176 1424 -368 1424
WIRE 16 1424 -176 1424
WIRE 64 1424 16 1424
WIRE -1200 1440 -1200 1408
WIRE -1152 1440 -1200 1440
WIRE -1632 1456 -1632 1344
WIRE -1248 1456 -1632 1456
WIRE 64 1472 64 1424
WIRE 64 1472 16 1472
WIRE -1152 1488 -1152 1440
WIRE -1152 1488 -1200 1488
WIRE 880 1488 880 1424
WIRE 1056 1488 880 1488
WIRE -1408 1504 -1408 1408
WIRE -1360 1504 -1408 1504
WIRE -640 1504 -640 1328
WIRE -32 1504 -640 1504
WIRE -1920 1520 -1920 976
WIRE -1920 1520 -1952 1520
WIRE -1632 1520 -1632 1456
WIRE -1632 1520 -1920 1520
WIRE -1248 1520 -1248 1456
WIRE -368 1520 -368 1424
WIRE -336 1520 -368 1520
WIRE -368 1536 -368 1520
WIRE 784 1536 784 1408
WIRE 784 1536 400 1536
WIRE -1360 1552 -1360 1504
WIRE -1360 1552 -1408 1552
WIRE 880 1552 880 1488
WIRE -1456 1584 -1520 1584
WIRE -1200 1584 -1200 1536
WIRE -1136 1584 -1200 1584
WIRE -336 1584 -336 1520
WIRE -336 1584 -368 1584
WIRE 16 1584 16 1520
WIRE 48 1584 16 1584
WIRE -1200 1600 -1200 1584
WIRE 912 1600 880 1600
WIRE -416 1616 -640 1616
WIRE 48 1632 48 1584
WIRE 48 1632 16 1632
WIRE 784 1632 784 1536
WIRE 832 1632 784 1632
WIRE -1824 1648 -1824 1088
WIRE -1824 1648 -1952 1648
WIRE -1600 1648 -1600 1376
WIRE -1600 1648 -1824 1648
WIRE -1248 1648 -1600 1648
WIRE -1136 1648 -1136 1584
WIRE -1136 1648 -1200 1648
WIRE -272 1664 -272 1328
WIRE -32 1664 -272 1664
WIRE 880 1664 880 1648
WIRE 912 1664 912 1600
WIRE 912 1664 880 1664
WIRE -1248 1680 -1248 1648
WIRE -1408 1696 -1408 1600
WIRE -1296 1696 -1408 1696
WIRE -1200 1696 -1296 1696
WIRE 16 1712 16 1680
WIRE 80 1712 16 1712
WIRE 880 1712 880 1664
WIRE 16 1728 16 1712
WIRE -1296 1744 -1296 1696
WIRE -640 1744 -640 1616
WIRE -640 1744 -1296 1744
WIRE -2096 1760 -2096 720
WIRE -1712 1760 -1712 1184
WIRE -1712 1760 -2096 1760
WIRE -1520 1760 -1520 1584
WIRE -1520 1760 -1712 1760
WIRE 80 1776 80 1712
WIRE 80 1776 16 1776
WIRE -1296 1792 -1296 1744
WIRE -1296 1792 -1424 1792
WIRE -1088 1792 -1296 1792
WIRE -96 1808 -96 1328
WIRE -32 1808 -96 1808
WIRE -1520 1824 -1520 1760
WIRE -1168 1824 -1520 1824
WIRE -1088 1824 -1088 1792
WIRE -1424 1840 -1424 1792
WIRE -368 1856 -368 1632
WIRE -208 1856 -368 1856
WIRE 16 1856 16 1824
WIRE 16 1856 -208 1856
WIRE -1024 1872 -1088 1872
WIRE -1392 1888 -1424 1888
WIRE -208 1888 -208 1856
WIRE 400 1888 400 1536
WIRE 400 1888 -208 1888
WIRE -1168 1904 -1168 1824
WIRE -1136 1904 -1168 1904
WIRE -1632 1920 -1632 1520
WIRE -1536 1920 -1632 1920
WIRE -1472 1920 -1536 1920
WIRE -640 1920 -640 1744
WIRE -240 1920 -640 1920
WIRE 400 1920 -240 1920
WIRE -1392 1936 -1392 1888
WIRE -1392 1936 -1424 1936
WIRE -1088 1936 -1088 1920
WIRE -1024 1936 -1024 1872
WIRE -1024 1936 -1088 1936
WIRE -256 1936 -464 1936
WIRE -272 1952 -448 1952
WIRE -208 1968 -208 1888
WIRE -208 1968 -384 1968
WIRE -16 1968 -208 1968
WIRE -1536 1984 -1536 1920
WIRE -1216 1984 -1536 1984
WIRE -1088 1984 -1088 1936
WIRE -1088 1984 -1168 1984
WIRE -992 1984 -1088 1984
WIRE 624 1984 624 960
WIRE 912 1984 624 1984
WIRE -1600 2000 -1600 1648
WIRE -1040 2000 -1600 2000
WIRE -336 2016 -384 2016
WIRE -1424 2032 -1424 1936
WIRE -1168 2032 -1168 1984
WIRE -992 2032 -992 1984
WIRE -880 2048 -880 976
WIRE -448 2048 -448 1952
WIRE -448 2048 -880 2048
WIRE -432 2048 -448 2048
WIRE 912 2048 912 1984
WIRE 960 2048 912 2048
WIRE -16 2064 -16 1968
WIRE 912 2064 912 2048
WIRE -1376 2080 -1424 2080
WIRE -1152 2080 -1168 2080
WIRE -960 2080 -992 2080
WIRE -384 2080 -384 2064
WIRE -336 2080 -336 2016
WIRE -336 2080 -384 2080
WIRE -1600 2112 -1600 2000
WIRE -1472 2112 -1600 2112
WIRE -1216 2112 -1216 1984
WIRE -1040 2112 -1040 2000
WIRE -384 2112 -384 2080
WIRE 16 2112 -16 2112
WIRE 960 2112 960 2048
WIRE 960 2112 912 2112
WIRE -240 2144 -240 1920
WIRE -64 2144 -240 2144
WIRE 864 2144 800 2144
WIRE -1424 2160 -1424 2128
WIRE -1376 2160 -1376 2080
WIRE -1376 2160 -1424 2160
WIRE -1248 2160 -1376 2160
WIRE -1168 2160 -1168 2128
WIRE -1168 2160 -1248 2160
WIRE -1152 2160 -1152 2080
WIRE -1152 2160 -1168 2160
WIRE -992 2160 -992 2128
WIRE -992 2160 -1152 2160
WIRE -960 2160 -960 2080
WIRE -960 2160 -992 2160
WIRE -336 2160 -384 2160
WIRE -16 2176 -16 2160
WIRE 16 2176 16 2112
WIRE 16 2176 -16 2176
WIRE -800 2192 -800 1088
WIRE -464 2192 -464 1936
WIRE -464 2192 -800 2192
WIRE -432 2192 -464 2192
WIRE 96 2224 -160 2224
WIRE 912 2224 912 2160
WIRE 1088 2224 912 2224
WIRE -384 2240 -384 2208
WIRE -336 2240 -336 2160
WIRE -336 2240 -384 2240
WIRE -256 2240 -256 1936
WIRE -48 2240 -256 2240
WIRE -160 2272 -160 2224
WIRE -160 2272 -496 2272
WIRE -16 2272 -16 2176
WIRE -16 2272 -112 2272
WIRE 32 2272 -16 2272
WIRE 176 2272 32 2272
WIRE 400 2272 400 1920
WIRE 800 2272 800 2144
WIRE 800 2272 400 2272
WIRE -384 2304 -384 2240
WIRE -112 2304 -112 2272
WIRE 32 2304 32 2272
WIRE 176 2304 176 2272
WIRE 912 2304 912 2224
WIRE -352 2352 -384 2352
WIRE -96 2352 -112 2352
WIRE 64 2352 32 2352
WIRE 208 2352 176 2352
WIRE 944 2352 912 2352
WIRE -704 2384 -704 1184
WIRE -496 2384 -496 2272
WIRE -496 2384 -704 2384
WIRE -432 2384 -496 2384
WIRE -272 2384 -272 1952
WIRE -160 2384 -272 2384
WIRE -48 2384 -48 2240
WIRE -16 2384 -48 2384
WIRE 96 2384 96 2224
WIRE 128 2384 96 2384
WIRE 800 2384 800 2272
WIRE 864 2384 800 2384
WIRE -384 2416 -384 2400
WIRE -352 2416 -352 2352
WIRE -352 2416 -384 2416
WIRE -160 2416 -352 2416
WIRE -112 2416 -112 2400
WIRE -112 2416 -160 2416
WIRE -96 2416 -96 2352
WIRE -96 2416 -112 2416
WIRE 32 2416 32 2400
WIRE 32 2416 -96 2416
WIRE 64 2416 64 2352
WIRE 64 2416 32 2416
WIRE 176 2416 176 2400
WIRE 176 2416 64 2416
WIRE 208 2416 208 2352
WIRE 208 2416 176 2416
WIRE 912 2416 912 2400
WIRE 944 2416 944 2352
WIRE 944 2416 912 2416
WIRE -2384 2544 -2384 672
WIRE -1248 2544 -1248 2160
WIRE -1248 2544 -2384 2544
WIRE -160 2544 -160 2416
WIRE -160 2544 -1248 2544
WIRE -144 2544 -160 2544
WIRE 912 2544 912 2416
WIRE 912 2544 -144 2544
WIRE -144 2656 -144 2544
FLAG -2096 -3904 A0
IOPIN -2096 -3904 In
FLAG -2096 -3776 B0
IOPIN -2096 -3776 In
FLAG -2096 -3664 Cin
IOPIN -2096 -3664 In
FLAG -1456 -4528 VDD
IOPIN -1456 -4528 In
FLAG 736 -3712 0
FLAG 912 -3936 S0
IOPIN 912 -3936 Out
FLAG -2000 -2000 A1
IOPIN -2000 -2000 In
FLAG -2000 -1872 B1
IOPIN -2000 -1872 In
FLAG 832 -1808 0
FLAG 1008 -2032 S1
IOPIN 1008 -2032 Out
FLAG -1968 -336 A2
IOPIN -1968 -336 In
FLAG -1968 -208 B2
IOPIN -1968 -208 In
FLAG 864 -144 0
FLAG -1952 1520 A3
IOPIN -1952 1520 In
FLAG -1952 1648 B3
IOPIN -1952 1648 In
FLAG 880 1712 0
FLAG 1056 1488 S3
IOPIN 1056 1488 Out
FLAG 1088 2224 Cout
IOPIN 1088 2224 Out
FLAG 1056 -352 S2
IOPIN 1056 -352 Out
FLAG -144 2656 GND
IOPIN -144 2656 Out
FLAG 1120 368 C3
IOPIN 1120 368 Out
SYMBOL pmos4 -1600 -4160 R0
SYMATTR InstName M1
SYMBOL pmos4 -1392 -4160 R0
SYMATTR InstName M2
SYMBOL pmos4 -1600 -3920 R0
SYMATTR InstName M3
SYMBOL pmos4 -1392 -3984 R0
SYMATTR InstName M4
SYMBOL pmos4 -1392 -3824 R0
SYMATTR InstName M5
SYMBOL nmos4 -1616 -3584 R0
SYMATTR InstName M6
SYMBOL nmos4 -1616 -3392 R0
SYMATTR InstName M7
SYMBOL nmos4 -1280 -3600 R0
SYMATTR InstName M8
SYMBOL nmos4 -1360 -3392 R0
SYMATTR InstName M9
SYMBOL nmos4 -1184 -3392 R0
SYMATTR InstName M10
SYMBOL pmos4 -576 -4176 R0
SYMATTR InstName M11
SYMBOL pmos4 -368 -4176 R0
SYMATTR InstName M12
SYMBOL pmos4 -176 -4176 R0
SYMATTR InstName M13
SYMBOL pmos4 -560 -3888 R0
SYMATTR InstName M14
SYMBOL pmos4 -176 -4000 R0
SYMATTR InstName M15
SYMBOL pmos4 -176 -3840 R0
SYMATTR InstName M16
SYMBOL pmos4 -176 -3696 R0
SYMATTR InstName M17
SYMBOL nmos4 -576 -3456 R0
SYMATTR InstName M18
SYMBOL nmos4 -576 -3312 R0
SYMATTR InstName M19
SYMBOL nmos4 -576 -3120 R0
SYMATTR InstName M20
SYMBOL nmos4 -208 -3360 R0
SYMATTR InstName M21
SYMBOL nmos4 -304 -3120 R0
SYMATTR InstName M22
SYMBOL nmos4 -160 -3120 R0
SYMATTR InstName M23
SYMBOL nmos4 -16 -3120 R0
SYMATTR InstName M24
SYMBOL pmos4 688 -4096 R0
SYMATTR InstName M25
SYMBOL pmos4 720 -3360 R0
SYMATTR InstName M26
SYMBOL nmos4 720 -3120 R0
SYMATTR InstName M27
SYMBOL nmos4 688 -3872 R0
SYMATTR InstName M28
SYMBOL pmos4 -1504 -2256 R0
SYMATTR InstName M29
SYMBOL pmos4 -1296 -2256 R0
SYMATTR InstName M30
SYMBOL pmos4 -1504 -2016 R0
SYMATTR InstName M31
SYMBOL pmos4 -1296 -2080 R0
SYMATTR InstName M32
SYMBOL pmos4 -1296 -1920 R0
SYMATTR InstName M33
SYMBOL nmos4 -1520 -1680 R0
SYMATTR InstName M34
SYMBOL nmos4 -1520 -1488 R0
SYMATTR InstName M35
SYMBOL nmos4 -1184 -1696 R0
SYMATTR InstName M36
SYMBOL nmos4 -1264 -1488 R0
SYMATTR InstName M37
SYMBOL nmos4 -1088 -1488 R0
SYMATTR InstName M38
SYMBOL pmos4 -480 -2272 R0
SYMATTR InstName M39
SYMBOL pmos4 -272 -2272 R0
SYMATTR InstName M40
SYMBOL pmos4 -80 -2272 R0
SYMATTR InstName M41
SYMBOL pmos4 -464 -1984 R0
SYMATTR InstName M42
SYMBOL pmos4 -80 -2096 R0
SYMATTR InstName M43
SYMBOL pmos4 -80 -1936 R0
SYMATTR InstName M44
SYMBOL pmos4 -80 -1792 R0
SYMATTR InstName M45
SYMBOL nmos4 -480 -1552 R0
SYMATTR InstName M46
SYMBOL nmos4 -480 -1408 R0
SYMATTR InstName M47
SYMBOL nmos4 -480 -1216 R0
SYMATTR InstName M48
SYMBOL nmos4 -112 -1456 R0
SYMATTR InstName M49
SYMBOL nmos4 -208 -1216 R0
SYMATTR InstName M50
SYMBOL nmos4 -64 -1216 R0
SYMATTR InstName M51
SYMBOL nmos4 80 -1216 R0
SYMATTR InstName M52
SYMBOL pmos4 784 -2192 R0
SYMATTR InstName M53
SYMBOL pmos4 816 -1456 R0
SYMATTR InstName M54
SYMBOL nmos4 816 -1216 R0
SYMATTR InstName M55
SYMBOL nmos4 784 -1968 R0
SYMATTR InstName M56
SYMBOL pmos4 -1472 -592 R0
SYMATTR InstName M57
SYMBOL pmos4 -1264 -592 R0
SYMATTR InstName M58
SYMBOL pmos4 -1472 -352 R0
SYMATTR InstName M59
SYMBOL pmos4 -1264 -416 R0
SYMATTR InstName M60
SYMBOL pmos4 -1264 -256 R0
SYMATTR InstName M61
SYMBOL nmos4 -1488 -16 R0
SYMATTR InstName M62
SYMBOL nmos4 -1488 176 R0
SYMATTR InstName M63
SYMBOL nmos4 -1152 -32 R0
SYMATTR InstName M64
SYMBOL nmos4 -1232 176 R0
SYMATTR InstName M65
SYMBOL nmos4 -1056 176 R0
SYMATTR InstName M66
SYMBOL pmos4 -448 -608 R0
SYMATTR InstName M67
SYMBOL pmos4 -240 -608 R0
SYMATTR InstName M68
SYMBOL pmos4 -48 -608 R0
SYMATTR InstName M69
SYMBOL pmos4 -432 -320 R0
SYMATTR InstName M70
SYMBOL pmos4 -48 -432 R0
SYMATTR InstName M71
SYMBOL pmos4 -48 -272 R0
SYMATTR InstName M72
SYMBOL pmos4 -48 -128 R0
SYMATTR InstName M73
SYMBOL nmos4 -448 112 R0
SYMATTR InstName M74
SYMBOL nmos4 -448 256 R0
SYMATTR InstName M75
SYMBOL nmos4 -448 448 R0
SYMATTR InstName M76
SYMBOL nmos4 -80 208 R0
SYMATTR InstName M77
SYMBOL nmos4 -176 448 R0
SYMATTR InstName M78
SYMBOL nmos4 -32 448 R0
SYMATTR InstName M79
SYMBOL nmos4 112 448 R0
SYMATTR InstName M80
SYMBOL pmos4 816 -528 R0
SYMATTR InstName M81
SYMBOL pmos4 848 208 R0
SYMATTR InstName M82
SYMBOL nmos4 848 448 R0
SYMATTR InstName M83
SYMBOL nmos4 816 -304 R0
SYMATTR InstName M84
SYMBOL pmos4 -1456 1264 R0
SYMATTR InstName M85
SYMBOL pmos4 -1248 1264 R0
SYMATTR InstName M86
SYMBOL pmos4 -1456 1504 R0
SYMATTR InstName M87
SYMBOL pmos4 -1248 1440 R0
SYMATTR InstName M88
SYMBOL pmos4 -1248 1600 R0
SYMATTR InstName M89
SYMBOL nmos4 -1472 1840 R0
SYMATTR InstName M90
SYMBOL nmos4 -1472 2032 R0
SYMATTR InstName M91
SYMBOL nmos4 -1136 1824 R0
SYMATTR InstName M92
SYMBOL nmos4 -1216 2032 R0
SYMATTR InstName M93
SYMBOL nmos4 -1040 2032 R0
SYMATTR InstName M94
SYMBOL pmos4 -432 1248 R0
SYMATTR InstName M95
SYMBOL pmos4 -224 1248 R0
SYMATTR InstName M96
SYMBOL pmos4 -32 1248 R0
SYMATTR InstName M97
SYMBOL pmos4 -416 1536 R0
SYMATTR InstName M98
SYMBOL pmos4 -32 1424 R0
SYMATTR InstName M99
SYMBOL pmos4 -32 1584 R0
SYMATTR InstName M100
SYMBOL pmos4 -32 1728 R0
SYMATTR InstName M101
SYMBOL nmos4 -432 1968 R0
SYMATTR InstName M102
SYMBOL nmos4 -432 2112 R0
SYMATTR InstName M103
SYMBOL nmos4 -432 2304 R0
SYMATTR InstName M104
SYMBOL nmos4 -64 2064 R0
SYMATTR InstName M105
SYMBOL nmos4 -160 2304 R0
SYMATTR InstName M106
SYMBOL nmos4 -16 2304 R0
SYMATTR InstName M107
SYMBOL nmos4 128 2304 R0
SYMATTR InstName M108
SYMBOL pmos4 832 1328 R0
SYMATTR InstName M109
SYMBOL pmos4 864 2064 R0
SYMATTR InstName M110
SYMBOL nmos4 864 2304 R0
SYMATTR InstName M111
SYMBOL nmos4 832 1552 R0
SYMATTR InstName M112
TEXT -5216 2472 Left 2 !.tran 100n

The netlist it stands for:
* 4bit_Adder.asc
M1 VDD A0 N002 VDD PMOS
M2 VDD B0 N002 VDD PMOS
M3 N002 Cin N006 N002 PMOS
M4 N002 A0 N004 N002 PMOS
M5 N004 B0 N006 N004 PMOS
M6 N006 A0 N009 N009 NMOS
M7 N009 B0 GND GND NMOS
M8 N006 Cin N008 N008 NMOS
M9 N008 A0 GND GND NMOS
M10 N008 B0 GND GND NMOS
M11 VDD A0 N001 VDD PMOS
M12 VDD B0 N001 VDD PMOS
M13 VDD Cin N001 VDD PMOS
M14 N001 N006 N003 N001 PMOS
M15 N001 A0 N005 N001 PMOS
M16 N005 B0 N007 N005 PMOS
M17 N007 Cin N003 N007 PMOS
M18 N003 A0 N010 N010 NMOS
M19 N010 B0 N012 N012 NMOS
M20 N012 Cin GND GND NMOS
M21 N003 N006 N011 N011 NMOS
M22 N011 A0 GND GND NMOS
M23 N011 B0 GND GND NMOS
M24 N011 Cin GND GND NMOS
M25 VDD N003 S0 VDD PMOS
M26 VDD N006 N013 VDD PMOS
M27 N013 N006 GND GND NMOS
M28 S0 N003 0 0 NMOS
M29 VDD A1 N015 VDD PMOS
M30 VDD B1 N015 VDD PMOS
M31 N015 N013 N019 N015 PMOS
M32 N015 A1 N017 N015 PMOS
M33 N017 B1 N019 N017 PMOS
M34 N019 A1 N022 N022 NMOS
M35 N022 B1 GND GND NMOS
M36 N019 N013 N021 N021 NMOS
M37 N021 A1 GND GND NMOS
M38 N021 B1 GND GND NMOS
M39 VDD A1 N014 VDD PMOS
M40 VDD B1 N014 VDD PMOS
M41 VDD N013 N014 VDD PMOS
M42 N014 N019 N016 N014 PMOS
M43 N014 A1 N018 N014 PMOS
M44 N018 B1 N020 N018 PMOS
M45 N020 N013 N016 N020 PMOS
M46 N016 A1 N023 N023 NMOS
M47 N023 B1 N025 N025 NMOS
M48 N025 N013 GND GND NMOS
M49 N016 N019 N024 N024 NMOS
M50 N024 A1 GND GND NMOS
M51 N024 B1 GND GND NMOS
M52 N024 N013 GND GND NMOS
M53 VDD N016 S1 VDD PMOS
M54 VDD N019 N026 VDD PMOS
M55 N026 N019 GND GND NMOS
M56 S1 N016 0 0 NMOS
M57 VDD A2 N028 VDD PMOS
M58 VDD B2 N028 VDD PMOS
M59 N028 N026 N032 N028 PMOS
M60 N028 A2 N030 N028 PMOS
M61 N030 B2 N032 N030 PMOS
M62 N032 A2 N035 N035 NMOS
M63 N035 B2 GND GND NMOS
M64 N032 N026 N034 N034 NMOS
M65 N034 A2 GND GND NMOS
M66 N034 B2 GND GND NMOS
M67 VDD A2 N027 VDD PMOS
M68 VDD B2 N027 VDD PMOS
M69 VDD N026 N027 VDD PMOS
M70 N027 N032 N029 N027 PMOS
M71 N027 A2 N031 N027 PMOS
M72 N031 B2 N033 N031 PMOS
M73 N033 N026 N029 N033 PMOS
M74 N029 A2 N036 N036 NMOS
M75 N036 B2 N038 N038 NMOS
M76 N038 N026 GND GND NMOS
M77 N029 N032 N037 N037 NMOS
M78 N037 A2 GND GND NMOS
M79 N037 B2 GND GND NMOS
M80 N037 N026 GND GND NMOS
M81 VDD N029 S2 VDD PMOS
M82 VDD N032 C3 VDD PMOS
M83 C3 N032 GND GND NMOS
M84 S2 N029 0 0 NMOS
M85 VDD A3 N040 VDD PMOS
M86 VDD B3 N040 VDD PMOS
M87 N040 C3 N044 N040 PMOS
M88 N040 A3 N042 N040 PMOS
M89 N042 B3 N044 N042 PMOS
M90 N044 A3 N047 N047 NMOS
M91 N047 B3 GND GND NMOS
M92 N044 C3 N046 N046 NMOS
M93 N046 A3 GND GND NMOS
M94 N046 B3 GND GND NMOS
M95 VDD A3 N039 VDD PMOS
M96 VDD B3 N039 VDD PMOS
M97 VDD C3 N039 VDD PMOS
M98 N039 N044 N041 N039 PMOS
M99 N039 A3 N043 N039 PMOS
M100 N043 B3 N045 N043 PMOS
M101 N045 C3 N041 N045 PMOS
M102 N041 A3 N048 N048 NMOS
M103 N048 B3 N050 N050 NMOS
M104 N050 C3 GND GND NMOS
M105 N041 N044 N049 N049 NMOS
M106 N049 A3 GND GND NMOS
M107 N049 B3 GND GND NMOS
M108 N049 C3 GND GND NMOS
M109 VDD N041 S3 VDD PMOS
M110 VDD N044 Cout VDD PMOS
M111 Cout N044 GND GND NMOS
M112 S3 N041 0 0 NMOS
.model NMOS NMOS
.model PMOS PMOS
.lib standard.mos
.tran 100n
.backanno
.end